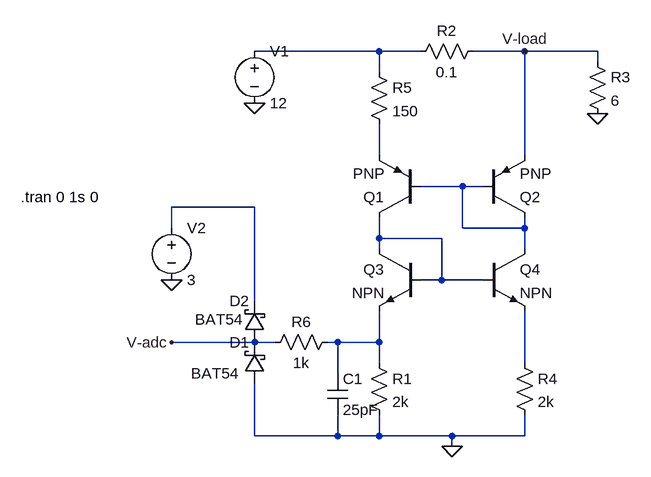
[diagram p0: schematic current_sense.asc]
current_sense.asc, the LTspice schematic file:
Version 4
SHEET 1 880 680
WIRE 112 -96 -80 -96
WIRE 176 -96 112 -96
WIRE 336 -96 256 -96
WIRE 448 -96 336 -96
WIRE 448 -80 448 -96
WIRE 112 -64 112 -96
WIRE 112 64 112 16
WIRE 336 64 336 -96
WIRE 240 112 176 112
WIRE 272 112 240 112
WIRE -80 144 -208 144
WIRE -208 176 -208 144
WIRE 240 176 240 112
WIRE 336 176 336 160
WIRE 336 176 240 176
WIRE 112 192 112 160
WIRE 208 192 112 192
WIRE 112 208 112 192
WIRE 336 208 336 176
WIRE 208 256 208 192
WIRE 208 256 176 256
WIRE 272 256 208 256
WIRE -80 288 -80 144
WIRE -80 352 -208 352
WIRE -48 352 -80 352
WIRE 48 352 32 352
WIRE 112 352 112 304
WIRE 112 352 48 352
WIRE 112 384 112 352
WIRE 336 384 336 304
WIRE 48 400 48 352
WIRE -80 496 -80 416
WIRE 48 496 48 464
WIRE 48 496 -80 496
WIRE 112 496 112 464
WIRE 112 496 48 496
WIRE 224 496 112 496
WIRE 336 496 336 464
WIRE 336 496 224 496
WIRE 224 512 224 496
FLAG -80 -16 0
FLAG 448 0 0
FLAG 336 -96 V-load
FLAG -208 352 V-adc
FLAG 224 512 0
FLAG -208 256 0
SYMBOL pnp 176 160 R180
SYMATTR InstName Q1
SYMBOL pnp 272 160 M180
SYMATTR InstName Q2
SYMBOL voltage -80 -112 R0
WINDOW 123 0 0 Left 0
WINDOW 39 0 0 Left 0
SYMATTR InstName V1
SYMATTR Value 12
SYMBOL res 272 -112 R90
WINDOW 0 0 56 VBottom 2
WINDOW 3 32 56 VTop 2
SYMATTR InstName R2
SYMATTR Value 0.1
SYMBOL res 432 -96 R0
SYMATTR InstName R3
SYMATTR Value 6
SYMBOL res 96 -80 R0
SYMATTR InstName R5
SYMATTR Value 150
SYMBOL npn 176 208 M0
SYMATTR InstName Q3
SYMBOL npn 272 208 R0
SYMATTR InstName Q4
SYMBOL res 96 368 R0
SYMATTR InstName R1
SYMATTR Value 2k
SYMBOL res 320 368 R0
SYMATTR InstName R4
SYMATTR Value 2k
SYMBOL schottky -64 416 R180
WINDOW 0 24 64 Left 2
WINDOW 3 40 16 Left 2
SYMATTR InstName D1
SYMATTR Value BAT54
SYMATTR Description Zener Diode
SYMATTR Type zener
SYMBOL schottky -64 352 R180
WINDOW 0 24 64 Left 2
WINDOW 3 34 35 Left 2
SYMATTR InstName D2
SYMATTR Value BAT54
SYMATTR Description Zener Diode
SYMATTR Type zener
SYMBOL voltage -208 160 R0
WINDOW 123 0 0 Left 0
WINDOW 39 0 0 Left 0
SYMATTR InstName V2
SYMATTR Value 3
SYMBOL res 48 336 R90
WINDOW 0 0 56 VBottom 2
WINDOW 3 32 56 VTop 2
SYMATTR InstName R6
SYMATTR Value 1k
SYMBOL cap 32 400 R0
SYMATTR InstName C1
SYMATTR Value 25pF
TEXT -440 128 Left 2 !.tran 0 1s 0

The netlist it stands for:
* current_sense.asc
Q1 N005 N003 N002 0 PNP
Q2 N003 N003 V-load 0 PNP
V1 N001 0 12
R2 V-load N001 0.1
R3 V-load 0 6
R5 N001 N002 150
Q3 N005 N005 N006 0 NPN
Q4 N003 N005 N007 0 NPN
R1 N006 0 2k
R4 N007 0 2k
D1 0 V-adc BAT54
D2 V-adc N004 BAT54
V2 N004 0 3
R6 N006 V-adc 1k
C1 N006 0 25pF
.model D D
.lib standard.dio
.model NPN NPN
.model PNP PNP
.lib standard.bjt
.tran 0 1s 0
.backanno
.end